# Altium schematic sheet LEDs_CONTROL_SHEET.SchDoc
size A4; SheetNumber: 6; SheetTotal: 10
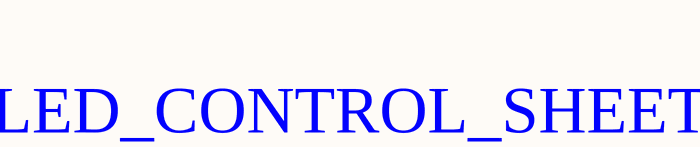
[diagram p0: LEDs_CONTROL_SHEET.SchDoc]

## Notes on the sheet
- LED_CONTROL_SHEET
- File:
- Title:
- Date:
- Page
- Num:
- Total:
- Drawn By: Huzaifa Ali